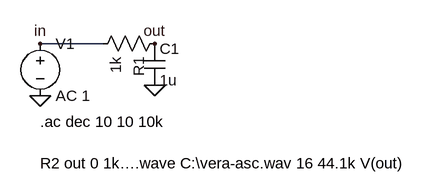
[diagram p0: schematic nel-text.asc]
nel-text.asc, the LTspice schematic file:
Version 4.1
SHEET 1 880 680
WIRE 96 16 0 16
FLAG 0 96 0
FLAG 176 80 0
FLAG 176 16 out
FLAG 0 16 in
SYMBOL voltage 0 0 R0
SYMATTR InstName V1
SYMATTR Value AC 1
SYMBOL res 192 0 R90
SYMATTR InstName R1
SYMATTR Value 1k
SYMBOL cap 160 16 R0
SYMATTR InstName C1
SYMATTR Value 1u
TEXT 0 136 Left 2 !.ac dec 10 10 10k
TEXT 0 200 Left 2 !R2 out 0 1k….wave C:\vera-asc.wav 16 44.1k V(out)

The netlist it stands for:
* nel-text.asc
V1 in 0 AC 1
R1 out in 1k
C1 out 0 1u
.ac dec 10 10 10k
R2 out 0 1k….wave C:\vera-asc.wav 16 44.1k V(out)
.backanno
.end